# Altium schematic sheet current_mode_controller.SchDoc
size A4; SheetNumber: 1; SheetTotal: 8
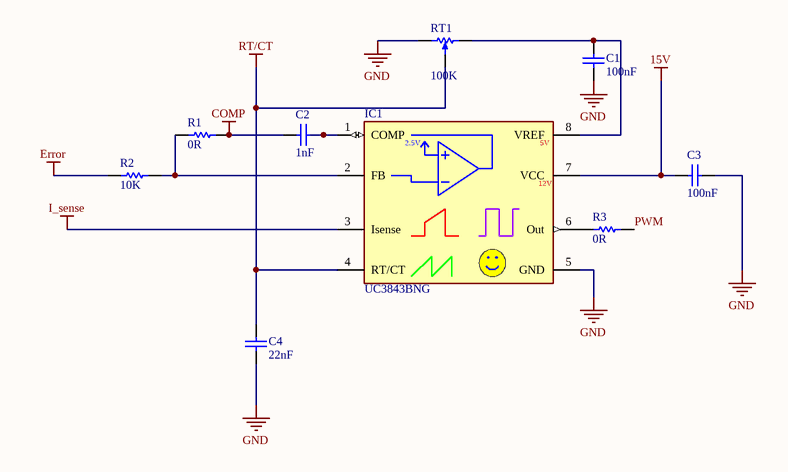
[diagram p0: current_mode_controller.SchDoc]

## Parts
C1  100nF  [CAPC1608L]
C2  1nF  [CAPC1608L]
C3  100nF  [CAPC1608L]
C4  22nF  [CAPC1608L]
IC1  UC3843BNG  [DIP794W56P254L959H533Q8B]
R1  0R  [RESC1608L]
R2  10K  [RESC1608L]
R3  0R  [RESC1608L]
RT1  100K  [PVZ2A]

## Nets
15V: C3.1 IC1.7(VCC)
COMP: C2.1 R1.2
Error: R2.1
GND: C1.1 C3.2 C4.1 IC1.5(GND) RT1.3(-)
I_sense: IC1.3(Isense)
RT/CT: C4.2 IC1.4(RT/CT) RT1.2(W)
PWM: R3.2
NetC1_2: C1.2 IC1.8(VREF) RT1.1
NetC2_2: C2.2 IC1.1(COMP)
NetIC1_2: IC1.2(FB) R1.1 R2.2
NetIC1_6: IC1.6(Out) R3.1

## Notes on the sheet
- (in symbol UC3843BNG) 2.5V; 5V; 12V

## Library data of the parts
C1 C3 = CC_100nF_0603: CAP CER 100nF X7R +-10% 50V 0603; PackageReference: 0603; Code_IPC: 1608 [0603]; Verify: *; Supplier: ECE Dept; Storage Location: PCB Assembly WS; Value: 100nF
C2 = CC_1nF_0603: CAP CER 1nF X7R +-10% 50V 0603; PackageReference: 0603; Code_IPC: 1608 [0603]; Verify: *; Supplier: ECE Dept; Storage Location: PCB Assembly WS; Value: 1nF
C4 = CC_22nF_0603: CAP CER 22nF X7R +-10% 50V 0603; PackageReference: 0603; Code_IPC: 1608 [0603]; Verify: *; Supplier: ECE Dept; Storage Location: PCB Assembly WS; Value: 22nF
IC1 = UC3843BNG: Integrated Circuit; Manufacturer_Name: ON Semiconductor; Datasheet Link: http://www.onsemi.com/pub/Collateral/UC3842B-D.PDF; Height: 5.33mm; Manufacturer_Part_Number: UC3843BNG; Arrow Part Number: UC3843BNG; Arrow Price/Stock: https://www.arrow.com/en/products/uc3843bng/on-semiconductor; Mouser Part Number: 863-UC3843BNG; Mouser Price/Stock: https://www.mouser.co.uk/ProductDetail/ON-Semiconductor/UC3843BNG?qs=xZq1yRCsb1c8CkSt0UbHMA%3D%3D
R1 R3 = RS_0R0: RES 0.0 OHM 1/10W 5% 0603 SMD; Storage Location: PCB Assembly WS; Supplier: ECE Dept; Value: 0R
R2 = RS_10K: RES 10.0K OHM 1/10W 5% 0603 SMD; Storage Location: PCB Assembly WS; Supplier: ECE Dept; Value: 10K
RT1 = RM_100K: Trim Pot SMD 100K Murata PVZ2 Series SMD; Manufacturer Part Number: PVZ2A104C04B00; Adjustment Type: Top; External Depth: 2.7; External Length / Height: 0.85; External Width: 2.1; No. of Turns: 1; Power Rating: 50; Resistor Element Material: Metal Foil; Manufacturer: MURATA; Storage Location: PCB Assembly WS; Potentiometer Mounting: SMD; Series: PVZ2; Supplier 1: Farnell; Supplier Part Number 1: 1771728; Supplier: ECE Dept; Value: 100K